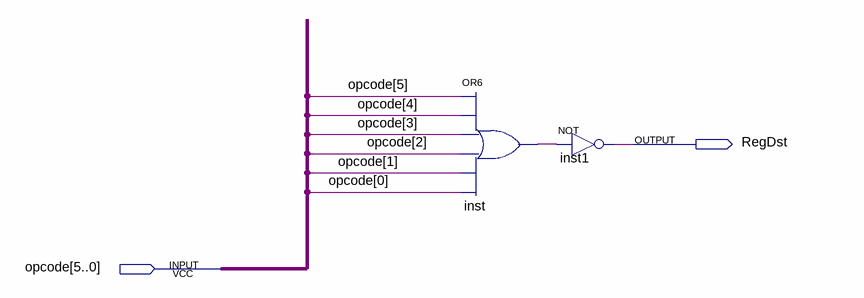
[diagram p0: schematic sheet]
// Quartus schematic RegDst.bdf as structural Verilog: 2 symbols, 2 pins
module RegDst (
  input  [5:0] opcode,
  output RegDst
);

  wire inst_out;

  or inst (inst_out, opcode[5], opcode[4], opcode[3], opcode[2], opcode[1], opcode[0]);
  not inst1 (RegDst, inst_out);
endmodule
